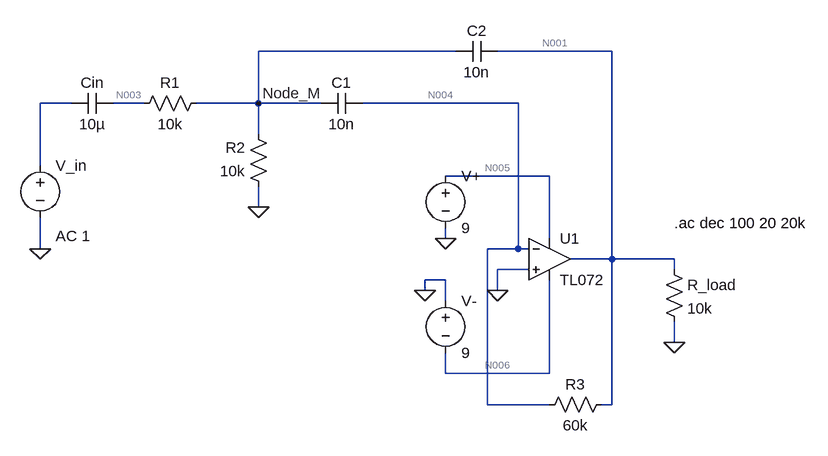
[diagram p0: schematic voice.asc]
* voice.asc
Cin N003 N002 10µ
R1 Node_M N003 10k
R2 0 Node_M 10k
C1 N004 Node_M 10n
* U1: TL072 (symbol TL072 not available, pins judged from their places): In+=0 In-=N004 V+=N005 V-=N006 OUT=N001
V_in N002 0 AC 1
V+ N005 0 9
V- 0 N006 9
C2 N001 Node_M 10n
R3 N001 N004 60k
R_load N001 0 10k
.ac dec 100 20 20k
.backanno
.end

* Results of the author's LTspice run, read from the files saved beside the schematic
* Operating Point, zero values left out:
*   V(n001) = 13.31 µV
*   V(n004) = 10.97 µV
*   V(n005) = 9 V
*   V(n006) = -9 V
*   I(R3) = 39.05 pA
*   I(R_load) = 1.331 nA
*   I(V+) = -8.594 mA
*   I(V-) = -8.595 mA
*   Ix(u1:1) = 39.05 pA
*   Ix(u1:2) = 39.05 pA
*   Ix(u1:3) = 8.594 mA
*   Ix(u1:4) = -8.595 mA
*   Ix(u1:5) = -1.37 nA
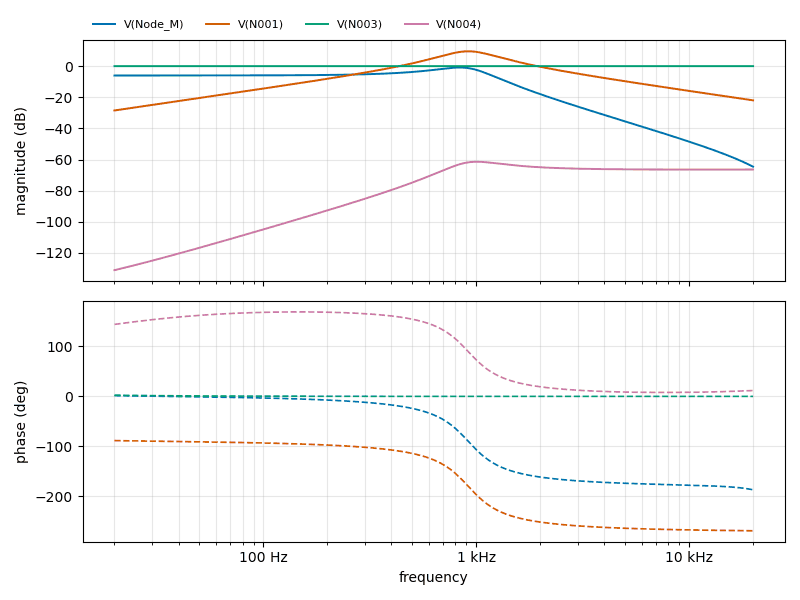
[diagram p1: AC Analysis of voice.asc, plotted from the saved traces]
* AC Analysis, 1 run:
*   V(Node_M): -6.03 dB at 20 Hz, -64.57 dB at 20 kHz, peak -0.89 dB at 833.7 Hz, 3 dB below the peak at 485.3 Hz and 1.081 kHz
*   V(N001): -28.48 dB at 20 Hz, -21.97 dB at 20 kHz, peak 9.53 dB at 914.2 Hz, 3 dB below the peak at 690.8 Hz and 1.222 kHz
*   V(N003): -0.01 dB at 20 Hz, 0.00 dB at 20 kHz, peak 0.00 dB at 20 kHz
*   V(N004): -131.03 dB at 20 Hz, -66.39 dB at 20 kHz, peak -61.40 dB at 1.002 kHz, 3 dB below the peak at 780.3 Hz and 1.737 kHz